# Altium schematic sheet Top-Sheet.SchDoc
size A; DocumentNumber: 1; SheetNumber: 1; SheetTotal: 3
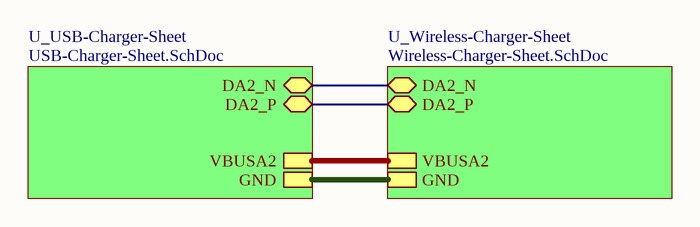
[diagram p0: Top-Sheet.SchDoc]

## Sub-sheets
U_USB-Charger-Sheet = USB-Charger-Sheet.SchDoc: DA2_N (bidir), DA2_P (bidir), VBUSA2, GND
U_Wireless-Charger-Sheet = Wireless-Charger-Sheet.SchDoc: VBUSA2, GND, DA2_N (bidir), DA2_P (bidir)

## Nets
(unnamed): sheet U_Wireless-Charger-Sheet/VBUSA2, sheet U_USB-Charger-Sheet/VBUSA2
(unnamed): sheet U_Wireless-Charger-Sheet/GND, sheet U_USB-Charger-Sheet/GND
(unnamed): sheet U_Wireless-Charger-Sheet/DA2_N, sheet U_USB-Charger-Sheet/DA2_N
(unnamed): sheet U_Wireless-Charger-Sheet/DA2_P, sheet U_USB-Charger-Sheet/DA2_P